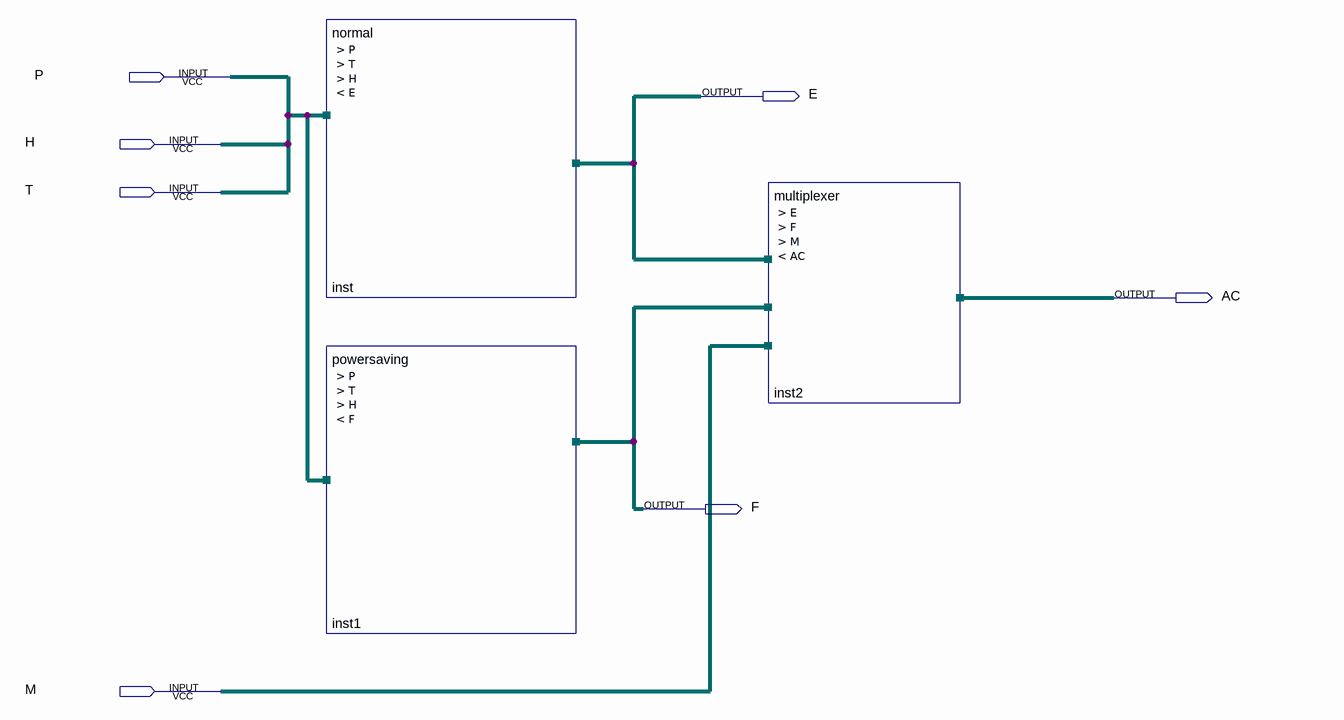
[diagram p0: schematic sheet]
// Quartus schematic Lab4_2.bdf as structural Verilog: 3 symbols, 7 pins
module Lab4_2 (
  input  P,
  input  H,
  input  T,
  input  M,
  output E,
  output AC,
  output F
);

  normal inst (.P(P), .T(T), .H(H), .E(E));
  powersaving inst1 (.P(P), .T(T), .H(H), .F(F));
  multiplexer inst2 (.E(E), .F(F), .M(M), .AC(AC));
endmodule
